# Altium project GTV4.0-V16_Lite.PrjPcb (part 6 of 9)

## Sheet Gate_Driver_Section.SchDoc
size 420 x 297 mm; DocumentNumber: 10; SheetNumber: 10; SheetTotal: 17
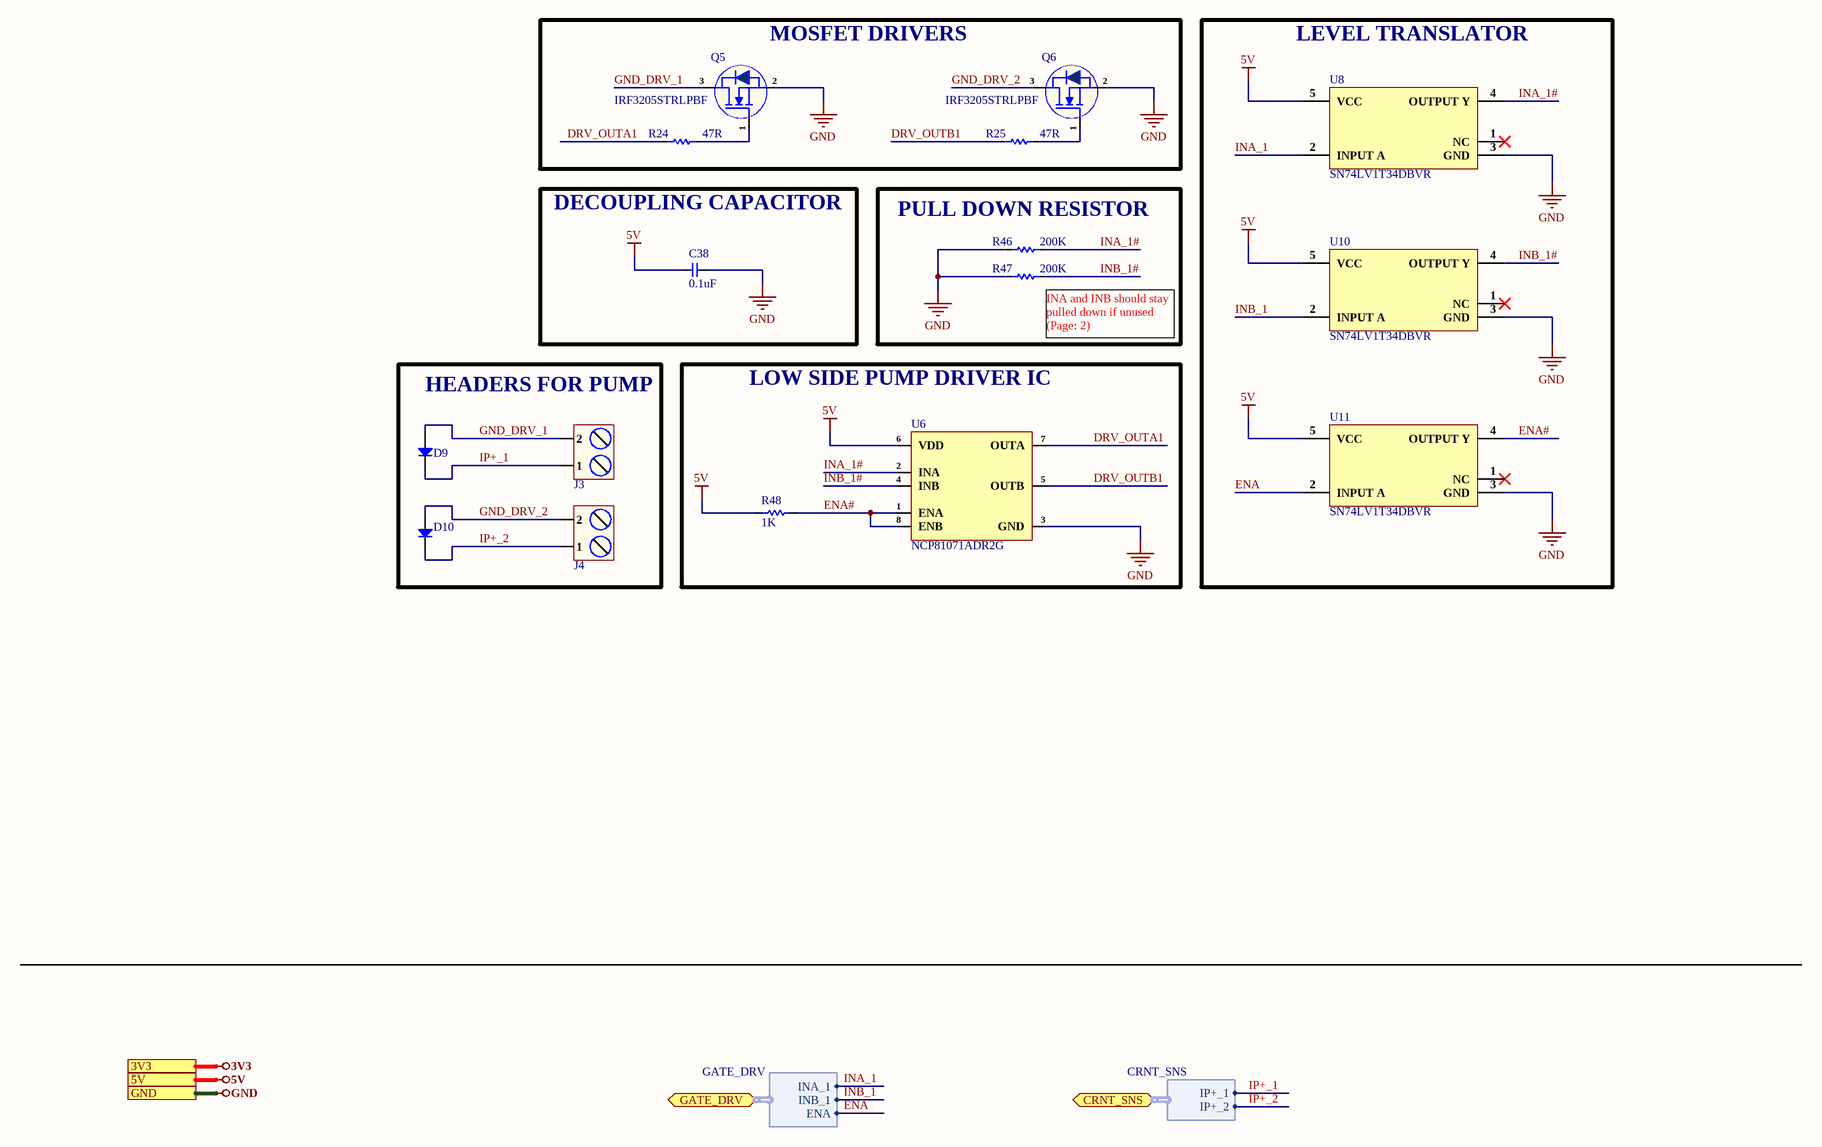
[diagram p5: Gate_Driver_Section.SchDoc]

### Parts
C38  0.1uF  [Cap-0603]
D9  1N4148W-7-F  [SOD-123]  (value not drawn)
D10  1N4148W-7-F  [SOD-123]  (value not drawn)
J3  TB008A-508-02BE  [TB008A-508-02BE]  (value not drawn)
J4  TB008A-508-02BE  [TB008A-508-02BE]  (value not drawn)
Q5  IRF3205STRLPBF  [D2Pak.]
Q6  IRF3205STRLPBF  [D2Pak.]
R24  47R  [Res-0603]
R25  47R  [Res-0603]
R46  200K  [Res-0603]
R47  200K  [Res-0603]
R48  1K  [Res-0603]
U6  NCP81071ADR2G  [SOIC-8]
U8  SN74LV1T34DBVR  [SOT-23-5]
U10  SN74LV1T34DBVR  [SOT-23-5]
U11  SN74LV1T34DBVR  [SOT-23-5]

### Blocks framed on the sheet
MOSFET DRIVERS: Q5 Q6 R24 R25
LEVEL TRANSLATOR: U8 U10 U11
DECOUPLING CAPACITOR: C38
PULL DOWN RESISTOR: R46 R47
HEADERS FOR PUMP: D9 D10 J3 J4
LOW SIDE PUMP DRIVER IC: R48 U6

### Ports
3V3, 5V, CRNT_SNS (bidir, harness CRNT_SNS), GATE_DRV (bidir, harness GATE_DRV), GND

### Harnesses
GATE_DRV: INA_1, INB_1, ENA
CRNT_SNS: IP+_1, IP+_2

### Nets
5V: C38.1 R48.1 U6.6(VDD) U8.5(VCC) U10.5(VCC) U11.5(VCC) ; port 5V
GND: C38.2 Q5.2(S) Q6.2(S) R46.1 R47.1 U6.3(GND) U8.3(GND) U10.3(GND) U11.3(GND) ; port GND
DRV_OUTA1: R24.1 U6.7(OUTA)
DRV_OUTB1: R25.1 U6.5(OUTB)
ENA: U11.2(INPUT_A) ; port GATE_DRV.ENA
ENA#: R48.2 U6.1(ENA) U6.8(ENB) U11.4(OUTPUT_Y)
GND_DRV_1: D9.1(A) J3.2 Q5.3(D)
GND_DRV_2: D10.1(A) J4.2 Q6.3(D)
INA_1: U8.2(INPUT_A) ; port GATE_DRV.INA_1
INA_1#: R46.2 U6.2(INA) U8.4(OUTPUT_Y)
INB_1: U10.2(INPUT_A) ; port GATE_DRV.INB_1
INB_1#: R47.2 U6.4(INB) U10.4(OUTPUT_Y)
IP+_1: D9.2(K) J3.1 ; port CRNT_SNS.IP+_1
IP+_2: D10.2(K) J4.1 ; port CRNT_SNS.IP+_2
NetQ5_1: Q5.1(G) R24.2
NetQ6_1: Q6.1(G) R25.2

Not connected (* = marked no-connect by the designer): U8 1(NC)*; U10 1(NC)*; U11 1(NC)*

### Notes on the sheet
- (near R47) INA and INB should stay pulled down if unused (Page: 2)
- File:
- Title:
- Date:
- Page
- Num:
- Total:
- Drawn By: Huzaifa Ali

### Library data of the parts
C38 = CC0603ZRY5V9BB104: CAP CER 0.1UF 50V Y5V 0603; Manufacturer: Yageo; Capacitance: 100nF; Tolerance: 80%; Item Type: Capacitor; Supplier 1: Digi-Key; Manufacturer Part Number: CC0603ZRY5V9BB104; Stock 1: 15000880; Pricing 1: 1=0.1, 10=0.075, 100=0.0334, 500=0.02386, 1000=0.01874 (USD); Mount: Surface Mount; Case/Package: 0603; Number of Pins: 2; Case Code (Metric): 1608; Case Code (Imperial): 0603; Min Operating Temperature: -30°C; Max Operating Temperature: 85°C; Dielectric: Y5V; Voltage Rating: 50V; Package Quantity: 1; Packaging: Tape and Reel; Voltage Rating (DC): 50V; Termination: SMD/SMT; Composition: Ceramic; Voltage: 50V; Length: 1.6mm; Height: 0.8mm; Width: 0.031inch; Thickness: 0.035inch; Depth: 0.8mm; Radiation Hardening: No; REACH SVHC: No SVHC; Lead Free: Lead Free; Halogen Free: Halogen Free; ComponentLink1URL: http://www.yageo.com/documents/recent/UPY-GPHC_Y5V_6.3V-to-50V_8.pdf?src-supplier=Digi-Key; ComponentLink1Description: http://www.yageo.com/documents/recent/UPY-GPHC_Y5V_6.3V-to-50V_8.pdf?src-supplier=Digi-Key; ComponentLink2URL: http://www.yageo.com/documents/recent/UPY-GPHC_Y5V_6.3V-to-50V_5.pdf?src-supplier=Avnet+Europe; ComponentLink2Description: http://www.yageo.com/documents/recent/UPY-GPHC_Y5V_6.3V-to-50V_5.pdf?src-supplier=Avnet+Europe; ComponentLink3URL: https://www.verical.com/server-webapp/html/getDatasheet?partID=403611&src-supplier=Verical; ComponentLink3Description: https://www.verical.com/server-webapp/html/getDatasheet?partID=403611&src-supplier=Verical; ComponentLink4URL: http://www.mouser.com/ds/2/447/Yageo_UPY-GP_NP0_16V-to-50V_9-358835.pdf?src-supplier=Mouser; ComponentLink4Description: http://www.mouser.com/ds/2/447/Yageo_UPY-GP_NP0_16V-to-50V_9-358835.pdf?src-supplier=Mouser; ComponentLink5URL: http://www.farnell.com/datasheets/1132289.pdf?src-supplier=Element14; ComponentLink5Description: http://www.farnell.com/datasheets/1132289.pdf?src-supplier=Element14; Supplier Part Number 1: 311-1343-1-ND; LCSC Part Number: C106221
D9 D10 = 1N4148W-7-F: DIODE GEN PURP 100V 300MA SOD123; Manufacturer: Diodes; Forward Current: 150mA; Reverse Recovery Time: 4ns; Max Forward Surge Current (Ifsm): 2A; Element Configuration: Single; Max Reverse Current: 1uA; Forward Voltage: 1.25V; Power Dissipation: 400mW; Polarity: Standard; Voltage Rating (DC): 75V; Value: 2pF; Supplier 1: Future Electronics; Manufacturer Part Number: 1N4148W-7-F; RoHS: Yes; Category: Rectifier Diodes; Stock 1: 32931000; Pricing 1: 3000=0.01840, 12000=0.01760, 45000=0.01690, 120000=0.01640, 300000=0.01560 (USD); Mounting Technology: Surface Mount; Pins: 2; Weight: 0.000353oz; Contact Plating: Tin,Matte; Min Operating Temperature: -65°C; Max Operating Temperature: 150°C; Packaging: Tape and Reel; Max Repetitive Reverse Voltage (Vrrm): 100V; Peak Non-Repetitive Surge Current: 2A; Voltage: 100V; Max Surge Current: 2A; Package Quantity: 3000; Recovery Time: 4ns; Average Rectified Current: 300mA; Power Rating: 400mW; Current Rating: 150mA; Output Current: 150mA; Max Reverse Voltage (DC): 100V; Series: -; Reverse Recovery Time-Max: 4ns; Length: 2.85mm; Width: 1.7mm; Height: 1.25mm; Radiation Hardening: No; RoHS Compliant: Yes; Reach SVHC Compliant: Yes; Lead Free: Lead Free; ComponentLink1URL: https://datasheet.ciiva.com/1179/1915529-1179304.pdf?src-supplier=Element14; ComponentLink1Description: https://datasheet.ciiva.com/1179/1915529-1179304.pdf?src-supplier=Element14; ComponentLink2URL: https://datasheet.ciiva.com/22695/1915529-22695239.pdf?src-supplier=Element14; ComponentLink2Description: https://datasheet.ciiva.com/22695/1915529-22695239.pdf?src-supplier=Element14; ComponentLink3URL: https://datasheet.ciiva.com/8300/ds30086-8300392.pdf?src-supplier=Avnet; ComponentLink3Description: https://datasheet.ciiva.com/8300/ds30086-8300392.pdf?src-supplier=Avnet; ComponentLink4URL: https://datasheet.ciiva.com/15219/getdatasheetpartid-110030-15219548.pdf?src-supplier=Verical; ComponentLink4Description: https://datasheet.ciiva.com/15219/getdatasheetpartid-110030-15219548.pdf?src-supplier=Verical; ComponentLink5URL: https://datasheet.ciiva.com/8303/ds30086-8303197.pdf?src-supplier=Avnet; ComponentLink5Description: https://datasheet.ciiva.com/8303/ds30086-8303197.pdf?src-supplier=Avnet; ComponentLink6URL: https://datasheet.ciiva.com/911/ds30086-911735.pdf?src-supplier=Digi-Key; ComponentLink6Description: https://datasheet.ciiva.com/911/ds30086-911735.pdf?src-supplier=Digi-Key; ComponentLink7URL: https://datasheet.ciiva.com/911/ds30086-911736.pdf?src-supplier=Digi-Key; ComponentLink7Description: https://datasheet.ciiva.com/911/ds30086-911736.pdf?src-supplier=Digi-Key; ComponentLink8URL: https://datasheet.ciiva.com/911/ds30086-911734.pdf?src-supplier=Digi-Key; ComponentLink8Description: https://datasheet.ciiva.com/911/ds30086-911734.pdf?src-supplier=Digi-Key; ComponentLink9URL: https://datasheet.ciiva.com/4435/ds30086-4435128.pdf?src-supplier=Mouser; ComponentLink9Description: https://datasheet.ciiva.com/4435/ds30086-4435128.pdf?src-supplier=Mouser; Supplier Part Number 1: 7634694; LCSC Part Number: C83528; Item Type: Diode
J3 J4 = TB008A-508-02BE: TERMINAL BLOCK, SCREW TYPE, 5.08; Manufacturer: Same Sky; Item Type: Terminal Blocks; Approvals: CE, IEC, UL, cUL; Current Rating: 16A; Number of Contacts: 2; Number of Levels: 1; Pitch: 5.08mm; Voltage Rating: 300V; Wire/Cable Gauge: 12AWG; Supplier: DigiKey; Supplier Part Number: 102-6213-ND; Manufacturer Part Number: TB008A-508-02BE; RoHS: Compliant; Stock: 2734; Pricing: 1=0.61, 10=0.451, 25=0.3932, 50=0.3542, 100=0.3198, 250=0.282, 500=0.25896, 1200=0.23595, 6000=0.20759 (USD); Color: Blue; Height: 15.82mm; Lifecycle Status: Production; Max Operating Temperature: 105°C; Min Operating Temperature: -40°C; Mounting Technology: Screw; Number of Rows: 1; Width: 13.89mm; ComponentLink1URL: https://datasheet.octopart.com:443/TB008A-508-02BE-Same-Sky-datasheet-181920260.pdf?src-supplier=Same+Sky; ComponentLink1Description: https://datasheet.octopart.com:443/TB008A-508-02BE-Same-Sky-datasheet-181920260.pdf?src-supplier=Same+Sky; ComponentLink2URL: https://datasheet.octopart.com:443/TB008A-508-02BE-CUI-Devices-datasheet-175928141.pdf?src-supplier=Same+Sky; ComponentLink2Description: https://datasheet.octopart.com:443/TB008A-508-02BE-CUI-Devices-datasheet-175928141.pdf?src-supplier=Same+Sky; ComponentLink3URL: https://datasheet.octopart.com:443/TB008A-508-02BE-CUI-Devices-datasheet-144794964.pdf?src-supplier=Same+Sky; ComponentLink3Description: https://datasheet.octopart.com:443/TB008A-508-02BE-CUI-Devices-datasheet-144794964.pdf?src-supplier=Same+Sky; ComponentLink4URL: https://datasheet.octopart.com:443/TB008A-508-02BE-CUI-Devices-datasheet-180438533.pdf?src-supplier=IHS; ComponentLink4Description: https://datasheet.octopart.com:443/TB008A-508-02BE-CUI-Devices-datasheet-180438533.pdf?src-supplier=IHS; ComponentLink5URL: https://datasheet.octopart.com:443/TB008A-508-02BE-Same-Sky-datasheet-182881448.pdf?src-supplier=Electro+Sonic; ComponentLink5Description: https://datasheet.octopart.com:443/TB008A-508-02BE-Same-Sky-datasheet-182881448.pdf?src-supplier=Electro+Sonic; ComponentLink6URL: https://datasheet.octopart.com:443/TB008A-508-02BE-CUI-Devices-datasheet-154730749.pdf?src-supplier=Electro+Sonic; ComponentLink6Description: https://datasheet.octopart.com:443/TB008A-508-02BE-CUI-Devices-datasheet-154730749.pdf?src-supplier=Electro+Sonic; ComponentLink7URL: https://datasheet.octopart.com:443/TB008A-508-02BE-CUI-Devices-datasheet-175927974.pdf?src-supplier=CUI+Devices+SCT; ComponentLink7Description: https://datasheet.octopart.com:443/TB008A-508-02BE-CUI-Devices-datasheet-175927974.pdf?src-supplier=CUI+Devices+SCT; ComponentLink8URL: https://datasheet.octopart.com:443/TB008A-508-02BE-CUI-Devices-datasheet-142371924.pdf?src-supplier=Future+Electronics; ComponentLink8Description: https://datasheet.octopart.com:443/TB008A-508-02BE-CUI-Devices-datasheet-142371924.pdf?src-supplier=Future+Electronics; ComponentLink9URL: https://datasheet.octopart.com:443/TB008A-508-02BE-Same-Sky-datasheet-182050257.pdf?src-supplier=Future+Electronics; ComponentLink9Description: https://datasheet.octopart.com:443/TB008A-508-02BE-Same-Sky-datasheet-182050257.pdf?src-supplier=Future+Electronics; ComponentLink10URL: https://datasheet.octopart.com:443/TB008A-508-02BE-CUI-Devices-datasheet-175928506.pdf?src-supplier=Future+Electronics; ComponentLink10Description: https://datasheet.octopart.com:443/TB008A-508-02BE-CUI-Devices-datasheet-175928506.pdf?src-supplier=Future+Electronics; ComponentLink11URL: https://datasheet.octopart.com:443/TB008A-508-02BE-CUI-Devices-datasheet-147843969.pdf?src-supplier=Future+Electronics; ComponentLink11Description: https://datasheet.octopart.com:443/TB008A-508-02BE-CUI-Devices-datasheet-147843969.pdf?src-supplier=Future+Electronics; ComponentLink12URL: https://octopart.com:443/opatz8j6/c1?t=70RcvCe5ZkRgGfEt3V6vu9Rs4fRjMXZXdN7o_jKjc1dIStjs0IdWQTWbo2m4XJFZN-ZP8jrAm8ZplrmsDRNZWu5vD1uRxoUEzG546i7xsfV2Hlacn1XvUR2XbUoQGro5ohP2MwvVjf8PoqdhdL5ostV4A3wznZJYIF3cjV4w5lqdbJSsZe_bWwCbg-0xN0VRUvfB1EMY8Vje3Eupa8s9ZFT71pkE5p7-eHFbrk2At8AAZTx0zaGgq3cGzzCo7b3plQZDv0g9EsQyQUqhBC4JyFJJTeTHRWNNhUkmN73PD8OCyLOPLnegennELhgJeyY7HD7r-bGsAjSnjBwQDgR4SNS6WopDa7PwSknd4UaR&src-supplier=Compliance+Statements; ComponentLink12Description: https://octopart.com:443/opatz8j6/c1?t=70RcvCe5ZkRgGfEt3V6vu9Rs4fRjMXZXdN7o_jKjc1dIStjs0IdWQTWbo2m4XJFZN-ZP8jrAm8ZplrmsDRNZWu5vD1uRxoUEzG546i7xsfV2Hlacn1XvUR2XbUoQGro5ohP2MwvVjf8PoqdhdL5ostV4A3wznZJYIF3cjV4w5lqdbJSsZe_bWwCbg-0xN0VRUvfB1EMY8Vje3Eupa8s9ZFT71pkE5p7-eHFbrk2At8AAZTx0zaGgq3cGzzCo7b3plQZDv0g9EsQyQUqhBC4JyFJJTeTHRWNNhUkmN73PD8OCyLOPLnegennELhgJeyY7HD7r-bGsAjSnjBwQDgR4SNS6WopDa7PwSknd4UaR&src-supplier=Compliance+Statements; ComponentLink13URL: https://octopart.com:443/opatz8j6/c1?t=Uo7J4IF8yNdenAOC46u8Tj87WKOsK2A7c2vs8Sa5WYpsHicIfMoXbTSbdSiyOVgpxAIJCnEdsRMUssp9co8EivZcQamcZCig1rv7D-Ug8PwU11654nZt9VBHHEO9J9O1TmTLkeOA50viz6XbUTUcFOxEIWFtOIpsQudSLNpXl0qwCRhM7cqCRnP2WYjdfnel41QgPMBd0OmGtB5n4xaHO6yfR0O84tGT4DFJu17jeSMsdcHZCnKlQJPS09wnjUoIgC30PVYN35xN_xndXGhnfduxGQWssTNdQ2Ew4lLPFXECETpUa_FU3_NIDCJhBmvudBKdEuF4t1En-YL9AhFUeE1LU0Iszw0AVyDT8Hn1nDsKYQ&src-supplier=Compliance+Statements; ComponentLink13Description: https://octopart.com:443/opatz8j6/c1?t=Uo7J4IF8yNdenAOC46u8Tj87WKOsK2A7c2vs8Sa5WYpsHicIfMoXbTSbdSiyOVgpxAIJCnEdsRMUssp9co8EivZcQamcZCig1rv7D-Ug8PwU11654nZt9VBHHEO9J9O1TmTLkeOA50viz6XbUTUcFOxEIWFtOIpsQudSLNpXl0qwCRhM7cqCRnP2WYjdfnel41QgPMBd0OmGtB5n4xaHO6yfR0O84tGT4DFJu17jeSMsdcHZCnKlQJPS09wnjUoIgC30PVYN35xN_xndXGhnfduxGQWssTNdQ2Ew4lLPFXECETpUa_FU3_NIDCJhBmvudBKdEuF4t1En-YL9AhFUeE1LU0Iszw0AVyDT8Hn1nDsKYQ&src-supplier=Compliance+Statements; ComponentLink14URL: https://octopart.com:443/opatz8j6/c1?t=QvKslLqyPFzau17NptgVLNRcuMhYIDBdCODdkHqrYmlyYaojLdNAUnoimpM8kJVdayLtCnbbKOALirt3kAy58b19LXjk0_7F41XvMIDT0eRXxnt9UHZUhX802G-ZzTsQIZnaFSbz4MEhjhtI2qswXHCzfmb8sqF0HXUhYlN6-rqlzfA-OyFj0jZaaAfm4-lvU9uPpsocCV1oKDEwT57xEscWeOARtAbVwqthJApLrBmKsw-5DWDhVMlxDbVvBXDO0fpzQdRNXWzvV5iRUvpPqWvudAW3YO1yLdtS--LwTFp95_TZ35xs_jHFthiTFDMmHALKuZGPmqbJgedvZH3Zk3g47VKlaCUtWvKEaHE3&src-supplier=Compliance+Statements; ComponentLink14Description: https://octopart.com:443/opatz8j6/c1?t=QvKslLqyPFzau17NptgVLNRcuMhYIDBdCODdkHqrYmlyYaojLdNAUnoimpM8kJVdayLtCnbbKOALirt3kAy58b19LXjk0_7F41XvMIDT0eRXxnt9UHZUhX802G-ZzTsQIZnaFSbz4MEhjhtI2qswXHCzfmb8sqF0HXUhYlN6-rqlzfA-OyFj0jZaaAfm4-lvU9uPpsocCV1oKDEwT57xEscWeOARtAbVwqthJApLrBmKsw-5DWDhVMlxDbVvBXDO0fpzQdRNXWzvV5iRUvpPqWvudAW3YO1yLdtS--LwTFp95_TZ35xs_jHFthiTFDMmHALKuZGPmqbJgedvZH3Zk3g47VKlaCUtWvKEaHE3&src-supplier=Compliance+Statements; ComponentLink15URL: https://octopart.com:443/opatz8j6/c1?t=vaYY41CogfnopSfDOPxoaqGeCdGNbbMVVihVh9piZThYC4z5UdzLQjuTDbTJQBTosCtHjK1U8s3WuliWmK31H20qTGz1dkr0vY7KPWk-lwdRYh6T0AVJBxjWCi0eVjFp9VnnwA-vZFto2L6_FJ-1JJOZC7c21m4C6LgLcEGoiZY5ivV0bdaUH14NZNWQcfXhucKYp6KsuPDjo6IvsvVydEIyl4r3dmRXALVohKm2RtfKZd3dTcnpmcifjmEzWhR-u4uu0vOGtKFb8OyaUtZ3gXgC8hliX2ctByKhLk-vsmWP8rGswQgdKk_F7i01fLK7QHLl5nXUFhOop_anT0dafluEmPu9S4IjVmRqgao-gzkWkw&src-supplier=Compliance+Statements; ComponentLink15Description: https://octopart.com:443/opatz8j6/c1?t=vaYY41CogfnopSfDOPxoaqGeCdGNbbMVVihVh9piZThYC4z5UdzLQjuTDbTJQBTosCtHjK1U8s3WuliWmK31H20qTGz1dkr0vY7KPWk-lwdRYh6T0AVJBxjWCi0eVjFp9VnnwA-vZFto2L6_FJ-1JJOZC7c21m4C6LgLcEGoiZY5ivV0bdaUH14NZNWQcfXhucKYp6KsuPDjo6IvsvVydEIyl4r3dmRXALVohKm2RtfKZd3dTcnpmcifjmEzWhR-u4uu0vOGtKFb8OyaUtZ3gXgC8hliX2ctByKhLk-vsmWP8rGswQgdKk_F7i01fLK7QHLl5nXUFhOop_anT0dafluEmPu9S4IjVmRqgao-gzkWkw&src-supplier=Compliance+Statements
Q5 Q6 = IRF3205STRLPBF: MOSFET N-CH 55V 110A D2PAK; Manufacturer: Infineon Technologies; Manufacturer Part Number: IRF3205STRLPBF; Package: D2PAK; ComponentLink1URL: https://www.lcsc.com/product-detail/MOSFETs_Infineon-Technologies-IRF3205STRLPBF_C2613.html; ComponentLink1Description: LCSC; LCSC Part Number: C2613; Item Type: Mosfet
R24 R25 = RC0603FR-0747RL: RES SMD 47OHM 0.1W 0603; Manufacturer: Yageo; Tolerance: 1%; Power Rating: 100mW; Voltage Rating (DC): 50V; Temperature Coefficient: 100ppm/°C; Voltage Rating: 75V; Supplier 1: Digi-Key; Manufacturer Part Number: RC0603FR-0747RL; RoHS: Yes; Category: Chip SMD Resistors; Stock 1: 596562; Pricing 1: 1=0.10000, 10=0.02400, 100=0.00970, 1000=0.00436, 2500=0.00378 (USD); Case/Package: 0603; Number of Pins: 2; Case Code (Imperial): 0603; Case Code (Metric): 1608; Weight: 7.1E-05oz; Size Code: 0603; Min Operating Temperature: -55°C; Max Operating Temperature: 155°C; Resistance: 47R; Packaging: Tape and Reel; Package Quantity: 1; Termination: SMD/SMT; Resistor Type: Thick Film; Number of Terminations: 2; Max Power Dissipation: 100mW; Features: Moisture Resistant; Series: RC; Construction: Rectangular; Resistance Tolerance: 1%; Length: 1.6mm; Width: 0.8mm; Height: 0.022inch; Depth: 0.8mm; REACH SVHC: Unknown; Lead Free: Lead Free; Military Standard: Not; RoHS Compliant: Yes; ComponentLink1URL: https://datasheet.ciiva.com/2453/pyu-r-int-thick-7-2453922.pdf?src-supplier=Digi-Key; ComponentLink1Description: https://datasheet.ciiva.com/2453/pyu-r-int-thick-7-2453922.pdf?src-supplier=Digi-Key; ComponentLink2URL: https://datasheet.ciiva.com/2453/pyu-r-int-thick-7-2453923.pdf?src-supplier=Digi-Key; ComponentLink2Description: https://datasheet.ciiva.com/2453/pyu-r-int-thick-7-2453923.pdf?src-supplier=Digi-Key; ComponentLink3URL: https://datasheet.ciiva.com/2453/pyu-r-int-thick-7-2453924.pdf?src-supplier=Digi-Key; ComponentLink3Description: https://datasheet.ciiva.com/2453/pyu-r-int-thick-7-2453924.pdf?src-supplier=Digi-Key; ComponentLink4URL: https://datasheet.ciiva.com/7746/443971-7746363.pdf?src-supplier=Element14; ComponentLink4Description: https://datasheet.ciiva.com/7746/443971-7746363.pdf?src-supplier=Element14; ComponentLink5URL: https://datasheet.ciiva.com/7746/443971-7746364.pdf?src-supplier=Element14; ComponentLink5Description: https://datasheet.ciiva.com/7746/443971-7746364.pdf?src-supplier=Element14; ComponentLink6URL: https://datasheet.ciiva.com/46440/1868787-46440908.pdf?src-supplier=Element14; ComponentLink6Description: https://datasheet.ciiva.com/46440/1868787-46440908.pdf?src-supplier=Element14; Supplier Part Number 1: 311-47.0HRCT-ND; LCSC Part Number: C114623
R46 R47 = RC0603FR-07200KL: RES SMD 200K OHM 1% 1/10W 0603; Manufacturer: Yageo; Item Type: Resistor; Manufacturer Part Number: RC0603FR-07200KL; Package: 0603; ComponentLink3URL: https://www.lcsc.com/product-detail/Chip-Resistor-Surface-Mount_YAGEO-RC0603FR-07200KL_C105574.html; ComponentLink3Description: LCSC; LCSC Part Number: C105574
R48 = RC0603FR-071KL: RES SMD 1K OHM 1% 1/10W 0603; Manufacturer: Yageo; Resistance: 1kR; Temperature Coefficient: 100ppm/°C; Power Rating: 100mW; Voltage Rating: 50V; Item type: Resistor; ComponentLink1URL: https://www.verical.com/server-webapp/html/getDatasheet?partID=409289&src-supplier=Verical; ComponentLink1Description: https://www.verical.com/server-webapp/html/getDatasheet?partID=409289&src-supplier=Verical; Supplier 1: Digi-Key; Manufacturer Part Number: RC0603FR-071KL; Stock 1: 21472395; Pricing 1: 1=0.1, 10=0.023, 100=0.0094, 1000=0.0042, 2500=0.0037 (USD); Case/Package: 0603; Contact Plating: Tin,Matte; Case Code (Imperial): 0603; Case Code (Metric): 1608; Min Operating Temperature: -55°C; Max Operating Temperature: 155°C; Tolerance: 1%; Composition: Thick Film; Packaging: Tape and Reel; Termination: SMD/SMT; Military Standard: Not; Length: 1.6mm; Height: 0.45mm; Depth: 0.8mm; Radiation Hardening: No; REACH SVHC: No SVHC; Lead Free: Lead Free; ComponentLink2URL: http://documents.rs-components.com/techlib://itc_doclist_GB.htm?stockno=5048928&src-supplier=RSComponents; ComponentLink2Description: http://documents.rs-components.com/techlib://itc_doclist_GB.htm?stockno=5048928&src-supplier=RSComponents; ComponentLink3URL: http://www.yageo.com/documents/recent/PYu-RC0603_51_RoHS_L_4.pdf?src-supplier=Avnet+Europe; ComponentLink3Description: http://www.yageo.com/documents/recent/PYu-RC0603_51_RoHS_L_4.pdf?src-supplier=Avnet+Europe; ComponentLink4URL: http://www.farnell.com/datasheets/2167052.pdf?src-supplier=Element14; ComponentLink4Description: http://www.farnell.com/datasheets/2167052.pdf?src-supplier=Element14; ComponentLink5URL: http://www.farnell.com/datasheets/1868787.pdf?src-supplier=Element14; ComponentLink5Description: http://www.farnell.com/datasheets/1868787.pdf?src-supplier=Element14; ComponentLink6URL: http://www.yageo.com/documents/recent/PYu-RC_Group_51_RoHS_L_2.pdf?src-supplier=Avnet; ComponentLink6Description: http://www.yageo.com/documents/recent/PYu-RC_Group_51_RoHS_L_2.pdf?src-supplier=Avnet; ComponentLink7URL: https://www.verical.com/server-webapp/html/getDatasheet?partID=404327&src-supplier=Verical; ComponentLink7Description: https://www.verical.com/server-webapp/html/getDatasheet?partID=404327&src-supplier=Verical; ComponentLink8URL: http://www.farnell.com/datasheets/443971.pdf?src-supplier=Element14; ComponentLink8Description: http://www.farnell.com/datasheets/443971.pdf?src-supplier=Element14; Supplier Part Number 1: 311-1.00KHRDKR-ND; LCSC Part Number: C22548
U6 = NCP81071ADR2G: IC GATE DRVR LOW-SIDE 8SOIC; Manufacturer: ON Semiconductor; Number of Outputs: 2; Max Supply Voltage: 20V; Min Supply Voltage: 4.5V; Max Output Current: 5A; Channel Type: Independent; Max Supply Current: 3mA; Supplier 1: Digi-Key; Manufacturer Part Number: NCP81071ADR2G; RoHS: Yes; Item Type: IC; Pricing 1: 1=1.40000, 10=1.25100, 25=1.18720, 100=0.97520, 250=0.91160, 500=0.80560, 1000=0.70000 (USD); Mount: Surface Mount; Case/Package: SOIC; Number of Pins: 8; Min Operating Temperature: -40°C; Max Operating Temperature: 140°C; Packaging: Cut Tape; Number of Drivers: 2; Length: 5mm; Width: 4mm; Height: 1.5mm; REACH SVHC: No SVHC; Lead Free: Lead Free; RoHS Compliant: Yes; ComponentLink1URL: https://datasheet.ciiva.com/48511/ncp81071-d-48511319.pdf?src-supplier=Avnet; ComponentLink1Description: https://datasheet.ciiva.com/48511/ncp81071-d-48511319.pdf?src-supplier=Avnet; Supplier Part Number 1: NCP81071ADR2GOSDKR-ND
U8 U10 U11 = SN74LV1T34DBVR: IC BUF NON-INVERT 5.5V SOT23-5; Manufacturer: Texas Instruments; Number of Elements: 1; Logic Function: Buffer,Inverting; High Level Output Current: -8mA; Low Level Output Current: 8mA; Min Supply Voltage: 1.6V; Polarity: Non-Inverting; Propagation Delay: 15.5ns; Quiescent Current: 1uA; Supplier 1: Digi-Key; Manufacturer Part Number: SN74LV1T34DBVR; Stock 1: 37360; Pricing 1: 1=0.43, 10=0.349, 25=0.3192, 100=0.2374, 250=0.2152, 500=0.17808, 1000=0.13356 (USD); Mount: Surface Mount; Case/Package: SOT-23-5; Number of Pins: 5; Weight: 0.000353oz; Min Operating Temperature: -40°C; Max Operating Temperature: 125°C; Packaging: Tape and Reel; Number of Bits per Element: 1; Number of Bits: 1; Package Quantity: 3000; Max Supply Voltage: 5.5V; Number of Input Lines: 1; Number of Output Lines: 1; Operating Supply Current: 8mA; Number of Channels: 1; Number of Inputs: 1; Number of Outputs: 1; Radiation Hardening: No; RoHS Compliant: Yes; REACH SVHC: No SVHC; Lead Free: Lead Free; ComponentLink1URL: http://www.ti.com/lit/pdf/sdyu001?src-supplier=Digi-Key; ComponentLink1Description: http://www.ti.com/lit/pdf/sdyu001?src-supplier=Digi-Key; ComponentLink2URL: http://www.ti.com/lit/ds/symlink/sn74lv1t34.pdf?src-supplier=Avnet; ComponentLink2Description: http://www.ti.com/lit/ds/symlink/sn74lv1t34.pdf?src-supplier=Avnet; Supplier Part Number 1: 296-37176-6-ND; LCSC Part Number: C100024; Item Type: IC

## Sheet Heater_Section.SchDoc
size 420 x 297 mm; DocumentNumber: 11; SheetNumber: 11; SheetTotal: 17
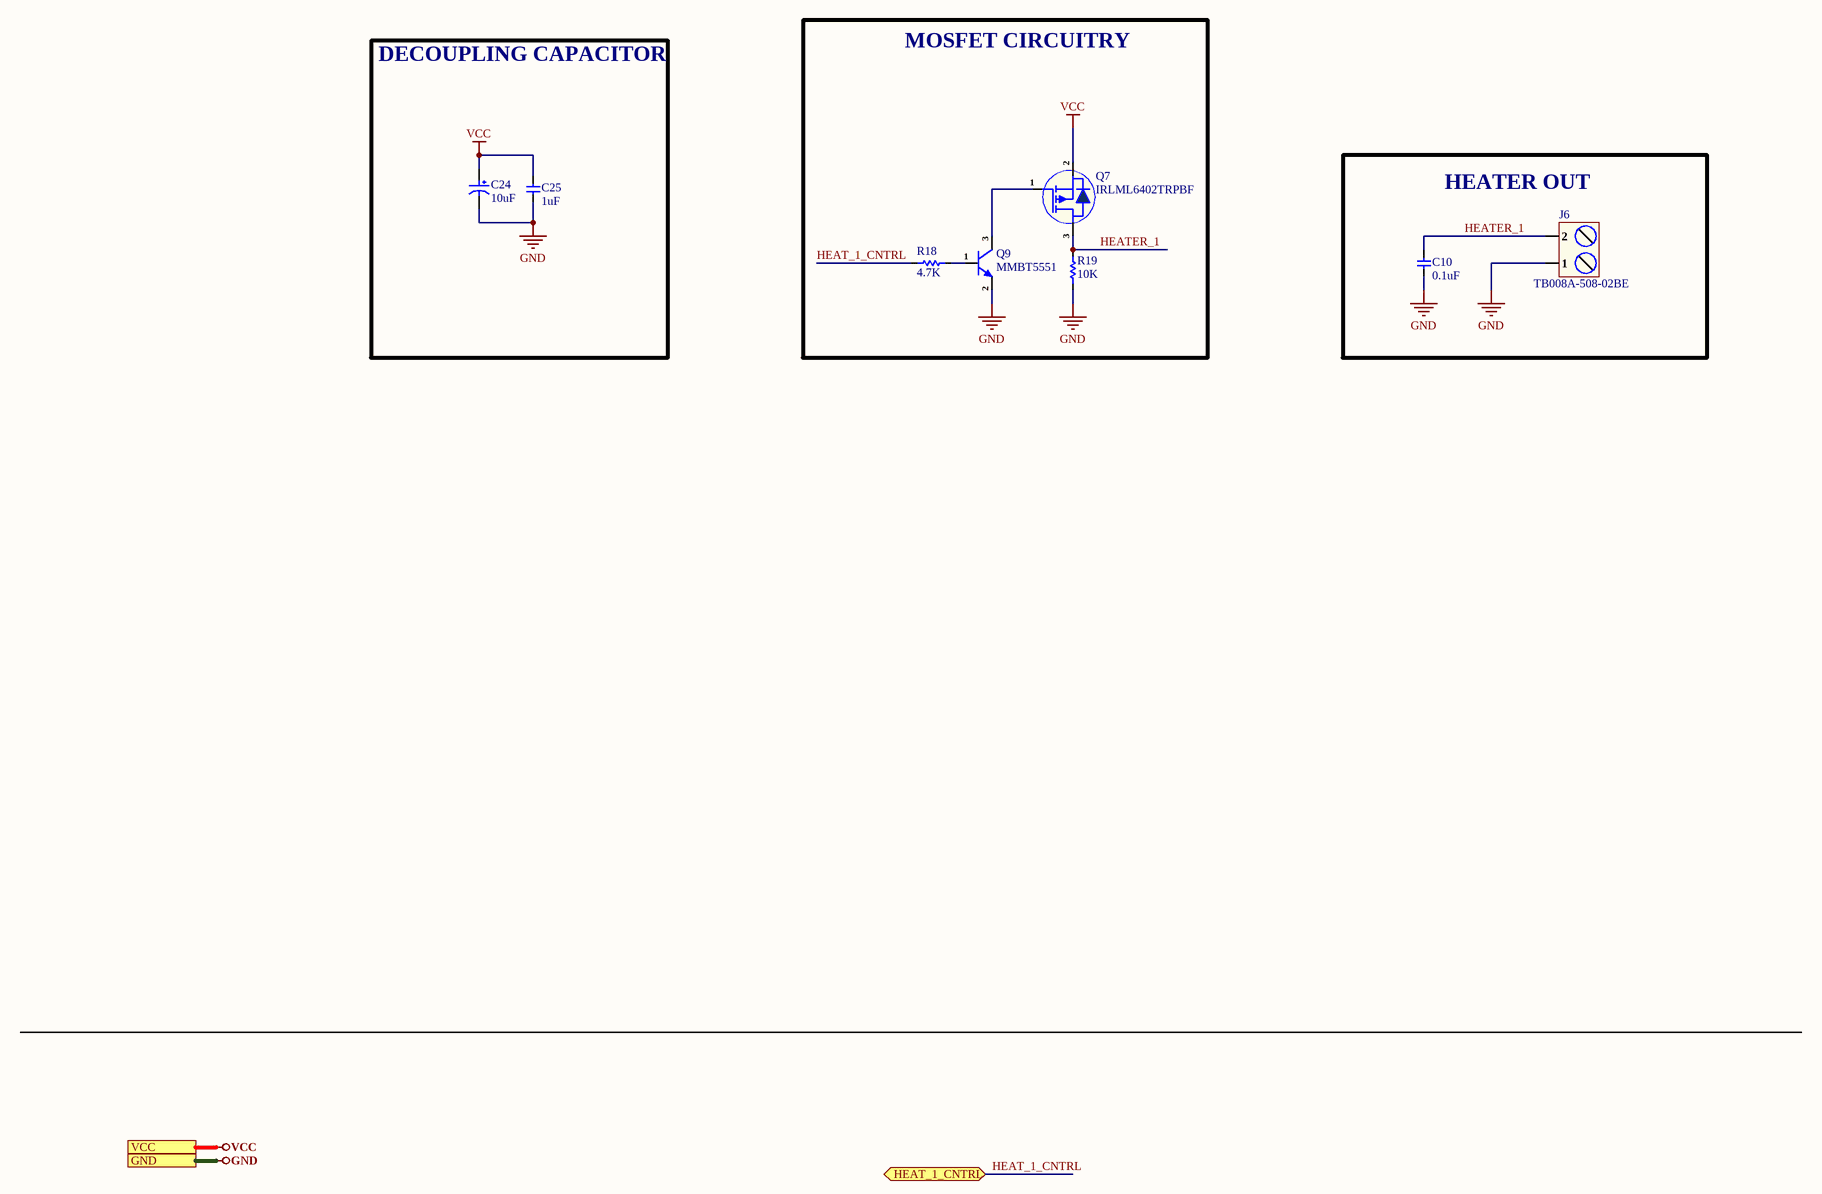
[diagram p6: Heater_Section.SchDoc]

### Parts
C10  0.1uF  [Cap-0603]
C24  10uF  [RVT1E100M0405_]
C25  1uF  [Cap-0603]
J6  TB008A-508-02BE  [TB008A-508-02BE]
Q7  IRLML6402TRPBF  [SOT-23]
Q9  MMBT5551  [SOT-23]
R18  4.7K  [Res-0402]
R19  10K  [Res-0603]

### Blocks framed on the sheet
MOSFET CIRCUITRY: Q7 Q9 R18 R19
DECOUPLING CAPACITOR: C24 C25
HEATER OUT: C10 J6

### Ports
GND, HEAT_1_CNTRL (bidir), VCC

### Nets
GND: C10.1 C24.2 C25.1 J6.1 Q9.2(E) R19.1 ; port GND
VCC: C24.1 C25.2 Q7.2(S) ; port VCC
HEAT_1_CNTRL: R18.1 ; port HEAT_1_CNTRL
HEATER_1: C10.2 J6.2 Q7.3(D) R19.2
NetQ7_1: Q7.1(G) Q9.3(C)
NetQ9_1: Q9.1(B) R18.2

### Notes on the sheet
- File:
- Title:
- Date:
- Page
- Num:
- Total:
- Drawn By: Huzaifa Ali

### Library data of the parts
C10 = CC0603ZRY5V9BB104: as C38 on sheet Gate_Driver_Section; Supplier 1: Digi-Key; Manufacturer Part Number: CC0603ZRY5V9BB104; Stock 1: 15000880; Pricing 1: 1=0.1, 10=0.075, 100=0.0334, 500=0.02386, 1000=0.01874 (USD); Mount: Surface Mount; Case/Package: 0603; Number of Pins: 2; Case Code (Metric): 1608; Case Code (Imperial): 0603; Min Operating Temperature: -30°C; Max Operating Temperature: 85°C; Dielectric: Y5V; Voltage Rating: 50V; Package Quantity: 1; Packaging: Tape and Reel; Voltage Rating (DC): 50V; Termination: SMD/SMT; Composition: Ceramic; Voltage: 50V; Length: 1.6mm; Height: 0.8mm; Width: 0.031inch; Thickness: 0.035inch; Depth: 0.8mm; Radiation Hardening: No; REACH SVHC: No SVHC; Lead Free: Lead Free; Halogen Free: Halogen Free; ComponentLink1URL: http://www.yageo.com/documents/recent/UPY-GPHC_Y5V_6.3V-to-50V_8.pdf?src-supplier=Digi-Key; ComponentLink1Description: http://www.yageo.com/documents/recent/UPY-GPHC_Y5V_6.3V-to-50V_8.pdf?src-supplier=Digi-Key; ComponentLink2URL: http://www.yageo.com/documents/recent/UPY-GPHC_Y5V_6.3V-to-50V_5.pdf?src-supplier=Avnet+Europe; ComponentLink2Description: http://www.yageo.com/documents/recent/UPY-GPHC_Y5V_6.3V-to-50V_5.pdf?src-supplier=Avnet+Europe; ComponentLink3URL: https://www.verical.com/server-webapp/html/getDatasheet?partID=403611&src-supplier=Verical; ComponentLink3Description: https://www.verical.com/server-webapp/html/getDatasheet?partID=403611&src-supplier=Verical; ComponentLink4URL: http://www.mouser.com/ds/2/447/Yageo_UPY-GP_NP0_16V-to-50V_9-358835.pdf?src-supplier=Mouser; ComponentLink4Description: http://www.mouser.com/ds/2/447/Yageo_UPY-GP_NP0_16V-to-50V_9-358835.pdf?src-supplier=Mouser; ComponentLink5URL: http://www.farnell.com/datasheets/1132289.pdf?src-supplier=Element14; ComponentLink5Description: http://www.farnell.com/datasheets/1132289.pdf?src-supplier=Element14; Supplier Part Number 1: 311-1343-1-ND; LCSC Part Number: C106221
C24 = RVT1E100M0405: CAP ALUM 10uF 25V SMD; Manufacturer: ROQANG; φD: 4mm; L: 5.4mm; Tolerance: ±20%; Item Type: Capacitor; Operating Temperature: -45℃~+105℃; Rated Voltage: 25V; Capacitance: 10uF; Manufacturer Part Number: RVT1E100M0405; ComponentLink1Description: LCSC; ComponentLink1URL: https://www.lcsc.com/product-detail/Aluminum-Electrolytic-Capacitors-SMD_10uF-25V-20_C72484.html; LCSC Part Number: C970655
C25 = CC0603KRX5R8BB105: CAP CER 1UF 25V X5R 0603; Manufacturer: Yageo; Tolerance: 10%; Item Type: Capacitor; Supplier 1: Digi-Key; Manufacturer Part Number: CC0603KRX5R8BB105; RoHS: Yes; Category: Ceramic Capacitors; Stock 1: 919939; Pricing 1: 1=0.12000, 10=0.08400, 50=0.04760, 100=0.03940, 500=0.02764, 1000=0.02288 (USD); Mount: Surface Mount; Case/Package: 0603; Number of Pins: 2; Case Code (Metric): 1608; Case Code (Imperial): 0603; Min Operating Temperature: -55°C; Max Operating Temperature: 85°C; Capacitance: 1uF; Dielectric: X5R; Package Quantity: 1; Voltage Rating: 25V; Packaging: Tape and Reel; Termination: SMD/SMT; Voltage Rating (DC): 25V; Series: CC; Construction: Flat; Length: 1.6mm; Width: 0.031inch; Height: 0.8mm; Thickness: 0.035inch; Depth: 0.8mm; Radiation Hardening: No; REACH SVHC: No SVHC; Lead Free: Lead Free; Halogen Free: Halogen Free; RoHS Compliant: Yes; ComponentLink1URL: https://datasheet.ciiva.com/176/mlccorderingcode-176785.pdf?src-supplier=Digi-Key; ComponentLink1Description: https://datasheet.ciiva.com/176/mlccorderingcode-176785.pdf?src-supplier=Digi-Key; ComponentLink2URL: https://datasheet.ciiva.com/176/mlccorderingcode-176786.pdf?src-supplier=Digi-Key; ComponentLink2Description: https://datasheet.ciiva.com/176/mlccorderingcode-176786.pdf?src-supplier=Digi-Key; ComponentLink3URL: https://datasheet.ciiva.com/176/mlccorderingcode-176787.pdf?src-supplier=Digi-Key; ComponentLink3Description: https://datasheet.ciiva.com/176/mlccorderingcode-176787.pdf?src-supplier=Digi-Key; ComponentLink4URL: https://datasheet.ciiva.com/17436/upy-gphc-x5r-4v-to-50v-12-17436952.pdf?src-supplier=Avnet+Europe; ComponentLink4Description: https://datasheet.ciiva.com/17436/upy-gphc-x5r-4v-to-50v-12-17436952.pdf?src-supplier=Avnet+Europe; ComponentLink5URL: https://datasheet.ciiva.com/7978/1525783-7978171.pdf?src-supplier=Element14; ComponentLink5Description: https://datasheet.ciiva.com/7978/1525783-7978171.pdf?src-supplier=Element14; ComponentLink6URL: https://datasheet.ciiva.com/11586/upy-gphc-x5r-4v-to-50v-12-11586318.pdf?src-supplier=Avnet; ComponentLink6Description: https://datasheet.ciiva.com/11586/upy-gphc-x5r-4v-to-50v-12-11586318.pdf?src-supplier=Avnet; Supplier Part Number 1: 311-1445-1-ND; LCSC Part Number: C14664
J6 = TB008A-508-02BE: as J3 on sheet Gate_Driver_Section; Supplier: DigiKey; Supplier Part Number: 102-6213-ND; Manufacturer Part Number: TB008A-508-02BE; RoHS: Compliant; Stock: 2734; Pricing: 1=0.61, 10=0.451, 25=0.3932, 50=0.3542, 100=0.3198, 250=0.282, 500=0.25896, 1200=0.23595, 6000=0.20759 (USD); Color: Blue; Height: 15.82mm; Lifecycle Status: Production; Max Operating Temperature: 105°C; Min Operating Temperature: -40°C; Mounting Technology: Screw; Number of Rows: 1; Width: 13.89mm; ComponentLink1URL: https://datasheet.octopart.com:443/TB008A-508-02BE-Same-Sky-datasheet-181920260.pdf?src-supplier=Same+Sky; ComponentLink1Description: https://datasheet.octopart.com:443/TB008A-508-02BE-Same-Sky-datasheet-181920260.pdf?src-supplier=Same+Sky; ComponentLink2URL: https://datasheet.octopart.com:443/TB008A-508-02BE-CUI-Devices-datasheet-175928141.pdf?src-supplier=Same+Sky; ComponentLink2Description: https://datasheet.octopart.com:443/TB008A-508-02BE-CUI-Devices-datasheet-175928141.pdf?src-supplier=Same+Sky; ComponentLink3URL: https://datasheet.octopart.com:443/TB008A-508-02BE-CUI-Devices-datasheet-144794964.pdf?src-supplier=Same+Sky; ComponentLink3Description: https://datasheet.octopart.com:443/TB008A-508-02BE-CUI-Devices-datasheet-144794964.pdf?src-supplier=Same+Sky; ComponentLink4URL: https://datasheet.octopart.com:443/TB008A-508-02BE-CUI-Devices-datasheet-180438533.pdf?src-supplier=IHS; ComponentLink4Description: https://datasheet.octopart.com:443/TB008A-508-02BE-CUI-Devices-datasheet-180438533.pdf?src-supplier=IHS; ComponentLink5URL: https://datasheet.octopart.com:443/TB008A-508-02BE-Same-Sky-datasheet-182881448.pdf?src-supplier=Electro+Sonic; ComponentLink5Description: https://datasheet.octopart.com:443/TB008A-508-02BE-Same-Sky-datasheet-182881448.pdf?src-supplier=Electro+Sonic; ComponentLink6URL: https://datasheet.octopart.com:443/TB008A-508-02BE-CUI-Devices-datasheet-154730749.pdf?src-supplier=Electro+Sonic; ComponentLink6Description: https://datasheet.octopart.com:443/TB008A-508-02BE-CUI-Devices-datasheet-154730749.pdf?src-supplier=Electro+Sonic; ComponentLink7URL: https://datasheet.octopart.com:443/TB008A-508-02BE-CUI-Devices-datasheet-175927974.pdf?src-supplier=CUI+Devices+SCT; ComponentLink7Description: https://datasheet.octopart.com:443/TB008A-508-02BE-CUI-Devices-datasheet-175927974.pdf?src-supplier=CUI+Devices+SCT; ComponentLink8URL: https://datasheet.octopart.com:443/TB008A-508-02BE-CUI-Devices-datasheet-142371924.pdf?src-supplier=Future+Electronics; ComponentLink8Description: https://datasheet.octopart.com:443/TB008A-508-02BE-CUI-Devices-datasheet-142371924.pdf?src-supplier=Future+Electronics; ComponentLink9URL: https://datasheet.octopart.com:443/TB008A-508-02BE-Same-Sky-datasheet-182050257.pdf?src-supplier=Future+Electronics; ComponentLink9Description: https://datasheet.octopart.com:443/TB008A-508-02BE-Same-Sky-datasheet-182050257.pdf?src-supplier=Future+Electronics; ComponentLink10URL: https://datasheet.octopart.com:443/TB008A-508-02BE-CUI-Devices-datasheet-175928506.pdf?src-supplier=Future+Electronics; ComponentLink10Description: https://datasheet.octopart.com:443/TB008A-508-02BE-CUI-Devices-datasheet-175928506.pdf?src-supplier=Future+Electronics; ComponentLink11URL: https://datasheet.octopart.com:443/TB008A-508-02BE-CUI-Devices-datasheet-147843969.pdf?src-supplier=Future+Electronics; ComponentLink11Description: https://datasheet.octopart.com:443/TB008A-508-02BE-CUI-Devices-datasheet-147843969.pdf?src-supplier=Future+Electronics; ComponentLink12URL: https://octopart.com:443/opatz8j6/c1?t=70RcvCe5ZkRgGfEt3V6vu9Rs4fRjMXZXdN7o_jKjc1dIStjs0IdWQTWbo2m4XJFZN-ZP8jrAm8ZplrmsDRNZWu5vD1uRxoUEzG546i7xsfV2Hlacn1XvUR2XbUoQGro5ohP2MwvVjf8PoqdhdL5ostV4A3wznZJYIF3cjV4w5lqdbJSsZe_bWwCbg-0xN0VRUvfB1EMY8Vje3Eupa8s9ZFT71pkE5p7-eHFbrk2At8AAZTx0zaGgq3cGzzCo7b3plQZDv0g9EsQyQUqhBC4JyFJJTeTHRWNNhUkmN73PD8OCyLOPLnegennELhgJeyY7HD7r-bGsAjSnjBwQDgR4SNS6WopDa7PwSknd4UaR&src-supplier=Compliance+Statements; ComponentLink12Description: https://octopart.com:443/opatz8j6/c1?t=70RcvCe5ZkRgGfEt3V6vu9Rs4fRjMXZXdN7o_jKjc1dIStjs0IdWQTWbo2m4XJFZN-ZP8jrAm8ZplrmsDRNZWu5vD1uRxoUEzG546i7xsfV2Hlacn1XvUR2XbUoQGro5ohP2MwvVjf8PoqdhdL5ostV4A3wznZJYIF3cjV4w5lqdbJSsZe_bWwCbg-0xN0VRUvfB1EMY8Vje3Eupa8s9ZFT71pkE5p7-eHFbrk2At8AAZTx0zaGgq3cGzzCo7b3plQZDv0g9EsQyQUqhBC4JyFJJTeTHRWNNhUkmN73PD8OCyLOPLnegennELhgJeyY7HD7r-bGsAjSnjBwQDgR4SNS6WopDa7PwSknd4UaR&src-supplier=Compliance+Statements; ComponentLink13URL: https://octopart.com:443/opatz8j6/c1?t=Uo7J4IF8yNdenAOC46u8Tj87WKOsK2A7c2vs8Sa5WYpsHicIfMoXbTSbdSiyOVgpxAIJCnEdsRMUssp9co8EivZcQamcZCig1rv7D-Ug8PwU11654nZt9VBHHEO9J9O1TmTLkeOA50viz6XbUTUcFOxEIWFtOIpsQudSLNpXl0qwCRhM7cqCRnP2WYjdfnel41QgPMBd0OmGtB5n4xaHO6yfR0O84tGT4DFJu17jeSMsdcHZCnKlQJPS09wnjUoIgC30PVYN35xN_xndXGhnfduxGQWssTNdQ2Ew4lLPFXECETpUa_FU3_NIDCJhBmvudBKdEuF4t1En-YL9AhFUeE1LU0Iszw0AVyDT8Hn1nDsKYQ&src-supplier=Compliance+Statements; ComponentLink13Description: https://octopart.com:443/opatz8j6/c1?t=Uo7J4IF8yNdenAOC46u8Tj87WKOsK2A7c2vs8Sa5WYpsHicIfMoXbTSbdSiyOVgpxAIJCnEdsRMUssp9co8EivZcQamcZCig1rv7D-Ug8PwU11654nZt9VBHHEO9J9O1TmTLkeOA50viz6XbUTUcFOxEIWFtOIpsQudSLNpXl0qwCRhM7cqCRnP2WYjdfnel41QgPMBd0OmGtB5n4xaHO6yfR0O84tGT4DFJu17jeSMsdcHZCnKlQJPS09wnjUoIgC30PVYN35xN_xndXGhnfduxGQWssTNdQ2Ew4lLPFXECETpUa_FU3_NIDCJhBmvudBKdEuF4t1En-YL9AhFUeE1LU0Iszw0AVyDT8Hn1nDsKYQ&src-supplier=Compliance+Statements; ComponentLink14URL: https://octopart.com:443/opatz8j6/c1?t=QvKslLqyPFzau17NptgVLNRcuMhYIDBdCODdkHqrYmlyYaojLdNAUnoimpM8kJVdayLtCnbbKOALirt3kAy58b19LXjk0_7F41XvMIDT0eRXxnt9UHZUhX802G-ZzTsQIZnaFSbz4MEhjhtI2qswXHCzfmb8sqF0HXUhYlN6-rqlzfA-OyFj0jZaaAfm4-lvU9uPpsocCV1oKDEwT57xEscWeOARtAbVwqthJApLrBmKsw-5DWDhVMlxDbVvBXDO0fpzQdRNXWzvV5iRUvpPqWvudAW3YO1yLdtS--LwTFp95_TZ35xs_jHFthiTFDMmHALKuZGPmqbJgedvZH3Zk3g47VKlaCUtWvKEaHE3&src-supplier=Compliance+Statements; ComponentLink14Description: https://octopart.com:443/opatz8j6/c1?t=QvKslLqyPFzau17NptgVLNRcuMhYIDBdCODdkHqrYmlyYaojLdNAUnoimpM8kJVdayLtCnbbKOALirt3kAy58b19LXjk0_7F41XvMIDT0eRXxnt9UHZUhX802G-ZzTsQIZnaFSbz4MEhjhtI2qswXHCzfmb8sqF0HXUhYlN6-rqlzfA-OyFj0jZaaAfm4-lvU9uPpsocCV1oKDEwT57xEscWeOARtAbVwqthJApLrBmKsw-5DWDhVMlxDbVvBXDO0fpzQdRNXWzvV5iRUvpPqWvudAW3YO1yLdtS--LwTFp95_TZ35xs_jHFthiTFDMmHALKuZGPmqbJgedvZH3Zk3g47VKlaCUtWvKEaHE3&src-supplier=Compliance+Statements; ComponentLink15URL: https://octopart.com:443/opatz8j6/c1?t=vaYY41CogfnopSfDOPxoaqGeCdGNbbMVVihVh9piZThYC4z5UdzLQjuTDbTJQBTosCtHjK1U8s3WuliWmK31H20qTGz1dkr0vY7KPWk-lwdRYh6T0AVJBxjWCi0eVjFp9VnnwA-vZFto2L6_FJ-1JJOZC7c21m4C6LgLcEGoiZY5ivV0bdaUH14NZNWQcfXhucKYp6KsuPDjo6IvsvVydEIyl4r3dmRXALVohKm2RtfKZd3dTcnpmcifjmEzWhR-u4uu0vOGtKFb8OyaUtZ3gXgC8hliX2ctByKhLk-vsmWP8rGswQgdKk_F7i01fLK7QHLl5nXUFhOop_anT0dafluEmPu9S4IjVmRqgao-gzkWkw&src-supplier=Compliance+Statements; ComponentLink15Description: https://octopart.com:443/opatz8j6/c1?t=vaYY41CogfnopSfDOPxoaqGeCdGNbbMVVihVh9piZThYC4z5UdzLQjuTDbTJQBTosCtHjK1U8s3WuliWmK31H20qTGz1dkr0vY7KPWk-lwdRYh6T0AVJBxjWCi0eVjFp9VnnwA-vZFto2L6_FJ-1JJOZC7c21m4C6LgLcEGoiZY5ivV0bdaUH14NZNWQcfXhucKYp6KsuPDjo6IvsvVydEIyl4r3dmRXALVohKm2RtfKZd3dTcnpmcifjmEzWhR-u4uu0vOGtKFb8OyaUtZ3gXgC8hliX2ctByKhLk-vsmWP8rGswQgdKk_F7i01fLK7QHLl5nXUFhOop_anT0dafluEmPu9S4IjVmRqgao-gzkWkw&src-supplier=Compliance+Statements
Q7 = IRLML6402TRPBF: MOSFET P-CH 20V 3.7A SOT23; Manufacturer: International Rectifier; Manufacturer Part Number: IRLML6402TRPBF; Package: SOT-23; LCSC Part Number: C5182043; Item Type: Mosfet; ComponentLink11Description: LCSC; ComponentLink11URL: https://www.lcsc.com/product-detail/MOSFETs_TECH-PUBLIC-IRLML6402TRPBF_C5182043.html
Q9 = MMBT5551: TRANS NPN 160V 0.6A SOT-23; Manufacturer: ON Semiconductor; Manufacturer Part Number: MMBT5551LT1G; Max Power Dissipation: 225mW; Max Collector Current: 600mA; Collector Base Voltage (VCBO): 180V; Emitter Base Voltage (VEBO): 6V; Element Configuration: Single; hFE Min: 80; Power Dissipation: 300mW; Number of Elements: 1; Collector Emitter Saturation Voltage: 150mV; Collector-emitter Voltage-Max: 200mV; Item Type: Transister; Supplier 1: Digi-Key; RoHS: Yes; Category: BJTs; Pricing 1: 1=0.22000, 10=0.17700, 100=0.09370, 500=0.06162, 1000=0.04190 (USD); Case/Package: SOT-23-3; Number of Pins: 3; Weight: 0.01lb; Contact Plating: Tin,Matte; Min Operating Temperature: -55°C; Max Operating Temperature: 150°C; Packaging: Tape and Reel; Collector Emitter Voltage (VCEO): 160V; Polarity: NPN; Package Quantity: 1; Collector Emitter Breakdown Voltage: 160V; Current Rating: 600mA; Voltage Rating (DC): 160V; Max Breakdown Voltage: 160V; Series: -; Length: 2.9mm; Width: 1.3mm; Height: 0.94mm; Radiation Hardening: No; Lead Free: Lead Free; REACH SVHC: No SVHC; RoHS Compliant: Yes; Supplier Part Number 1: MMBT5551LT1GOSDKR-ND; LCSC Part Number: C909756; ComponentLink14Description: LCSC; ComponentLink14URL: https://www.lcsc.com/product-detail/Bipolar-Transistors-BJT_Jiangsu-Changjing-Electronics-Technology-Co-Ltd-MMBT5551_C2145.html
R18 = RC0402FR-074K7L: RES 4.7K OHM 1% 1/16W 0402; Manufacturer: Yageo; Voltage Rating (DC): 50V; Power Rating: 62.5mW; Resistance: 4.7kR; Temperature Coefficient: 100ppm/°C; Max Power Dissipation: 63mW; Item Type: Resistor; Supplier 1: Avnet; Manufacturer Part Number: RC0402FR-074K7L; RoHS: Yes; Category: Chip SMD Resistors; Stock 1: 2420000; Pricing 1: 10000=0.00085 (USD); Case/Package: 0402; Number of Pins: 2; Case Code (Imperial): 0402; Case Code (Metric): 1005; Size Code: 0402; Min Operating Temperature: -55°C; Max Operating Temperature: 155°C; Tolerance: 1%; Voltage Rating: 50V; Packaging: Tape and Reel; Resistor Type: Thick Film; Termination: SMD/SMT; Features: Moisture Resistant; Series: RC; Number of Terminations: 2; Resistance Tolerance: 1%; Construction: Rectangular; Length: 1mm; Width: 0.5mm; Height: 0.32mm; Depth: 0.5mm; Height - Seated (Max): 0.016inch; RoHS Compliant: Yes; Reach SVHC Compliant: Yes; Military Standard: Not; Lead Free: Lead Free; ComponentLink1URL: https://datasheet.ciiva.com/22661/1686128-22661342.pdf?src-supplier=Element14; ComponentLink1Description: https://datasheet.ciiva.com/22661/1686128-22661342.pdf?src-supplier=Element14; ComponentLink2URL: https://datasheet.ciiva.com/7850/1018594-7850022.pdf?src-supplier=Element14; ComponentLink2Description: https://datasheet.ciiva.com/7850/1018594-7850022.pdf?src-supplier=Element14; ComponentLink3URL: https://datasheet.ciiva.com/7850/1018594-7850023.pdf?src-supplier=Element14; ComponentLink3Description: https://datasheet.ciiva.com/7850/1018594-7850023.pdf?src-supplier=Element14; ComponentLink4URL: https://datasheet.ciiva.com/15215/getdatasheetpartid-328119-15215035.pdf?src-supplier=Verical; ComponentLink4Description: https://datasheet.ciiva.com/15215/getdatasheetpartid-328119-15215035.pdf?src-supplier=Verical; Supplier Part Number 1: RC0402FR-074K7L; LCSC Part Number: C105871
R19 = RK73G1JTTD1002F: RES 10K OHM 1% 1/10W 0603; Item Type: Resistor; Value: 10kR; Power Rating: 100mW; Voltage Rating: 75V; Temperature Coefficient: 50ppm/°C; LCSC Part Number: C362180; ComponentLink1Description: LCSC; Supplier: Digi-Key; Supplier Part Number: 2019-RK73G1JTTD1002FCT-ND; RoHS: Yes; Category: Chip SMD Resistors; Stock: 249394; Pricing: 1=0.22, 10=0.118, 50=0.0812, 100=0.0699, 500=0.0513, 1000=0.04545 (USD); Case/Package: 0603; Case Code (Imperial): 0603; Case Code (Metric): 1608; Min Operating Temperature: -55°C; Max Operating Temperature: 125°C; Tolerance: 1%; Packaging: Tape and Reel; Termination: SMD/SMT; Series: RK73G; Construction: Rectangular; Length: 1.6mm; Depth: 0.8mm; Military Standard: Not; RoHS Compliant: Yes; ComponentLink2URL: http://www.mouser.com/ds/2/219/RK73G-9863.pdf?src-supplier=Mouser; ComponentLink2Description: http://www.mouser.com/ds/2/219/RK73G-9863.pdf?src-supplier=Mouser